# Altium schematic sheet Pin_Analogico.SchDoc
size A; SheetNumber: 6; SheetTotal: 7
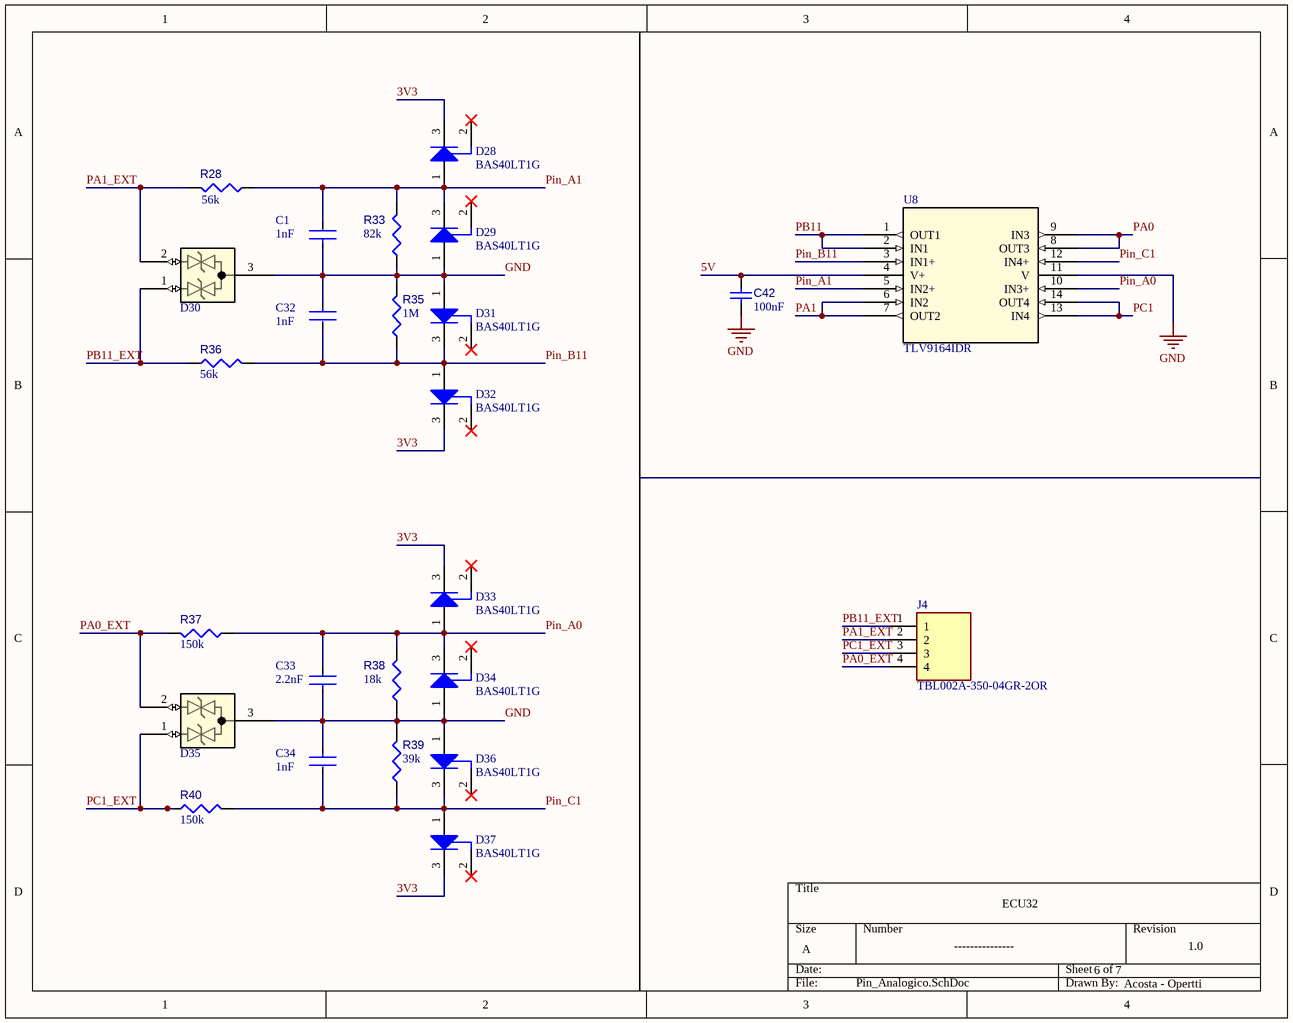
[diagram p0: Pin_Analogico.SchDoc]

## Parts
C1  Capacitance: 1nF  [FP-RCE0DB-MFG]  (hidden comment: RCE5C1H100J0A2H03B)
C32  Capacitance: 1nF  [FP-RCE0DB-MFG]  (hidden comment: RCE5C1H100J0A2H03B)
C33  Capacitance: 2.2nF  [FP-RCE0DB-MFG]  (hidden comment: RCE5C1H100J0A2H03B)
C34  Capacitance: 1nF  [FP-RCE0DB-MFG]  (hidden comment: RCE5C1H100J0A2H03B)
C42  value 100nF  [Capacitor cerámico TH-Footprint-1]  (hidden comment: Capacitor cerámico TH)
D28  BAS40LT1G  [ONSC-SOT-23-3-318-08_V]
D29  BAS40LT1G  [ONSC-SOT-23-3-318-08_V]
D30  ESD2CAN36DBZRQ1  [SOT-23-3_DBZ_TEX]  (value not drawn)
D31  BAS40LT1G  [ONSC-SOT-23-3-318-08_V]
D32  BAS40LT1G  [ONSC-SOT-23-3-318-08_V]
D33  BAS40LT1G  [ONSC-SOT-23-3-318-08_V]
D34  BAS40LT1G  [ONSC-SOT-23-3-318-08_V]
D35  ESD2CAN36DBZRQ1  [SOT-23-3_DBZ_TEX]  (value not drawn)
D36  BAS40LT1G  [ONSC-SOT-23-3-318-08_V]
D37  BAS40LT1G  [ONSC-SOT-23-3-318-08_V]
J4  TBL002A-350-04GR-2OR  [CUI_TBL002A-350-04GR-2OR]
R28  value 56k  [RESA60-630X240]  (hidden comment: MFR-25FBF52-47R5)
R33  value 82k  [RESA60-630X240]  (hidden comment: MFR-25FBF52-47R5)
R35  value 1M  [RESA60-630X240]  (hidden comment: MFR-25FBF52-47R5)
R36  value 56k  [RESA60-630X240]  (hidden comment: MFR-25FBF52-47R5)
R37  value 150k  [RESA60-630X240]  (hidden comment: MFR-25FBF52-47R5)
R38  value 18k  [RESA60-630X240]  (hidden comment: MFR-25FBF52-47R5)
R39  value 39k  [RESA60-630X240]  (hidden comment: MFR-25FBF52-47R5)
R40  value 150k  [RESA60-630X240]  (hidden comment: MFR-25FBF52-47R5)
U8  TLV9164IDR  [TLV9164IDR-Footprint-1]

## Nets
GND: C1.1 C32.1 C33.1 C34.1 C42.1 D29.1(A) D30.3(GND) D31.1(A) D34.1(A) D35.3(GND) D36.1(A) R33.2 R35.2 R38.2 R39.2 U8.11(V)
3V3: D28.3(K) D32.3(K) D33.3(K) D37.3(K)
5V: C42.2 U8.4(V+)
PA0: U8.8(OUT3) U8.9(IN3)
PA0_EXT: D35.2(IO) J4.4 R37.1
PA1: U8.6(IN2) U8.7(OUT2)
PA1_EXT: D30.2(IO) J4.2 R28.1
PB11: U8.1(OUT1) U8.2(IN1)
PB11_EXT: D30.1(IO) J4.1 R36.1
PC1: U8.13(IN4) U8.14(OUT4)
PC1_EXT: D35.1(IO) J4.3 R40.1
Pin_A0: C33.2 D33.1(A) D34.3(K) R37.2 R38.1 U8.10(IN3+)
Pin_A1: C1.2 D28.1(A) D29.3(K) R28.2 R33.1 U8.5(IN2+)
Pin_B11: C32.2 D31.3(K) D32.1(A) R35.1 R36.2 U8.3(IN1+)
Pin_C1: C34.2 D36.3(K) D37.1(A) R39.1 R40.2 U8.12(IN4+)

Not connected (* = marked no-connect by the designer): D28 2(NC)*; D29 2(NC)*; D31 2(NC)*; D32 2(NC)*; D33 2(NC)*; D34 2(NC)*; D36 2(NC)*; D37 2(NC)*

## Notes on the sheet
- ECU32
- ---------------
- 6
- 7
- 1.0
- Acosta - Opertti

## Library data of the parts
C1 C32-C34 = CMP-06035-046743-1: Cap Ceramic 10pF 50V C0G ±5% Radial 2.5mm +125°C Bulk; Lead Diameter: 0.5mm; Lead/Base Style: Straight; Width: 2.5mm; Voltage Rating: 50V; Max Operating Temperature: 125°C; Length: 0.142inch; Lead Pitch: 0.098inch; Min Operating Temperature: -55°C; Termination: Radial; Tolerance: 5%; Dielectric: C0G; Packaging: Bulk; Package Quantity: 500; Voltage Rating (DC): 50V; Case/Package: Radial; Ratings: AEC-Q200; Lead Free: Lead Free; Height: 3.5mm; Resistor Type: Ceramic; Height - Seated (Max): 0.138inch; Mount: Through Hole
C42 = CMP-001-00083-4
D28 D29 D31-D34 D36 D37 = CMP-1055-00540-1: Schottky Barrier Diode, 3-Pin SOT-23, Pb-Free, Tape and Reel; Manufacturer: On Semiconductor; Configuration: Single; ComponentLink3Description: Package Specification; ComponentLink1URL: http://www.onsemi.com/; ComponentLink2Description: Datasheet; PackageDescription: 3-Pin Small Outline Transistor, Body 2.92 x 1.3 mm, Pitch 0.95 mm; ComponentLink3URL: http://www.onsemi.cn/pub_link/Collateral/318-08.PDF; PartNumber: BAS40LT1G; DatasheetVersion: Rev. 10; Packing: Tape and Reel; PackageReference: SOT-23-3-318-08; ComponentLink1Description: Manufacturer URL; ComponentLink2URL: http://www.onsemi.cn/pub_link/Collateral/BAS40LT1-D.PDF; RoHS: TRUE; Mounting Technology: Surface Mount; PackageVersion: Rev. AP, 11/2009
D30 D35 = CMP-004-00031-1: Automotive, two-channel bidirectional 36V ESD protection diode 3-SOT-23 -55 to 150; Manufacturer_Name: Texas Instruments; Design Item ID: ESD2CAN36DBZRQ1; Copyright: Copyright (C) 2025 Ultra Librarian. All rights reserved.; Source: ESD2CAN36DBZRQ1.SchLib; Manufacturer_Part_Number: ESD2CAN36DBZRQ1; Type: Type; RefDes: RefDes
J4 = CMP-002-00073-1: 1~24 Poles, Screwless, 45Â°, 3.50 Pitch, 24~20 (AWG), Terminal Block Connector; MF: Same Sky; Check_prices: https://www.snapeda.com/parts/TBL002A-350-04GR-2OR/Same+Sky/view-part/?ref=eda; MP: TBL002A-350-04GR-2OR; Design Item ID: TBL002A-350-04GR-2OR; Case/Package: None; Source: TBL002A-350-04GR-2OR.SchLib; Pins: 4; Value: *; SnapEDA_Link: https://www.snapeda.com/parts/TBL002A-350-04GR-2OR/Same+Sky/view-part/?ref=snap; Component Type: Standard
R28 R33 R35-R40 = CMP-009-00058-4: Axial Resistor, 47.5 Ohm, +/- 1%, 0.25 W, -55 to 155 degC, 2-Pin THD, RoHS, Bulk; Manufacturer: Yageo; Voltage Rating: 250V; Power: 250mW; Packaging: Bulk; Package Description: 2-Pin Axial Lead, Dia 2.4 mm, Body Length 6.3 mm; Package Reference: MFR-25; Case/Package: Axial; Tolerance: 1%; RoHS Compliant: True; Package Quantity: 200; Max Operating Temperature: 155°C; Manufacturer URL: http://www.yageo.com/; Datasheet URL: http://www.yageo.com/documents/recent/Yageo%20LR_MFR_2013.pdf; Min Operating Temperature: -55°C; Datasheet Version: Apr-13; Mounting Technology: TH
U8 = CMP-00009-1: Quad, 16-V, 11-MHz rail-to-rail input and output low-offset-voltage operational amplifier 14-SOIC -40 to 125; Manufacturer Lifecycle Status: ACTIVE; Number of Channels: 4; Width: 3.91mm; Thickness: 1.58mm; Case/Package: SOIC; Height: 0m; Lifecycle Status: Production; Pins: 14; RoHS: Compliant; Length: 8.65mm